# Altium schematic sheet AD592_2.SchDoc: AD592BNZ
size 410 x 297 mm; ApprovedBy: Стерхов В.Д.; CheckedBy: Стерхов В.Д.; Author: Сергеев Д.А.; CompanyName: ГК "СНАБЖЕНИЕ"; Engineer: Сергеев Д.А.; Organization: ГК "СНАБЖЕНИЕ"; DocumentNumber: ИЛ1339ТО1/1; SheetNumber: 2; SheetTotal: 3
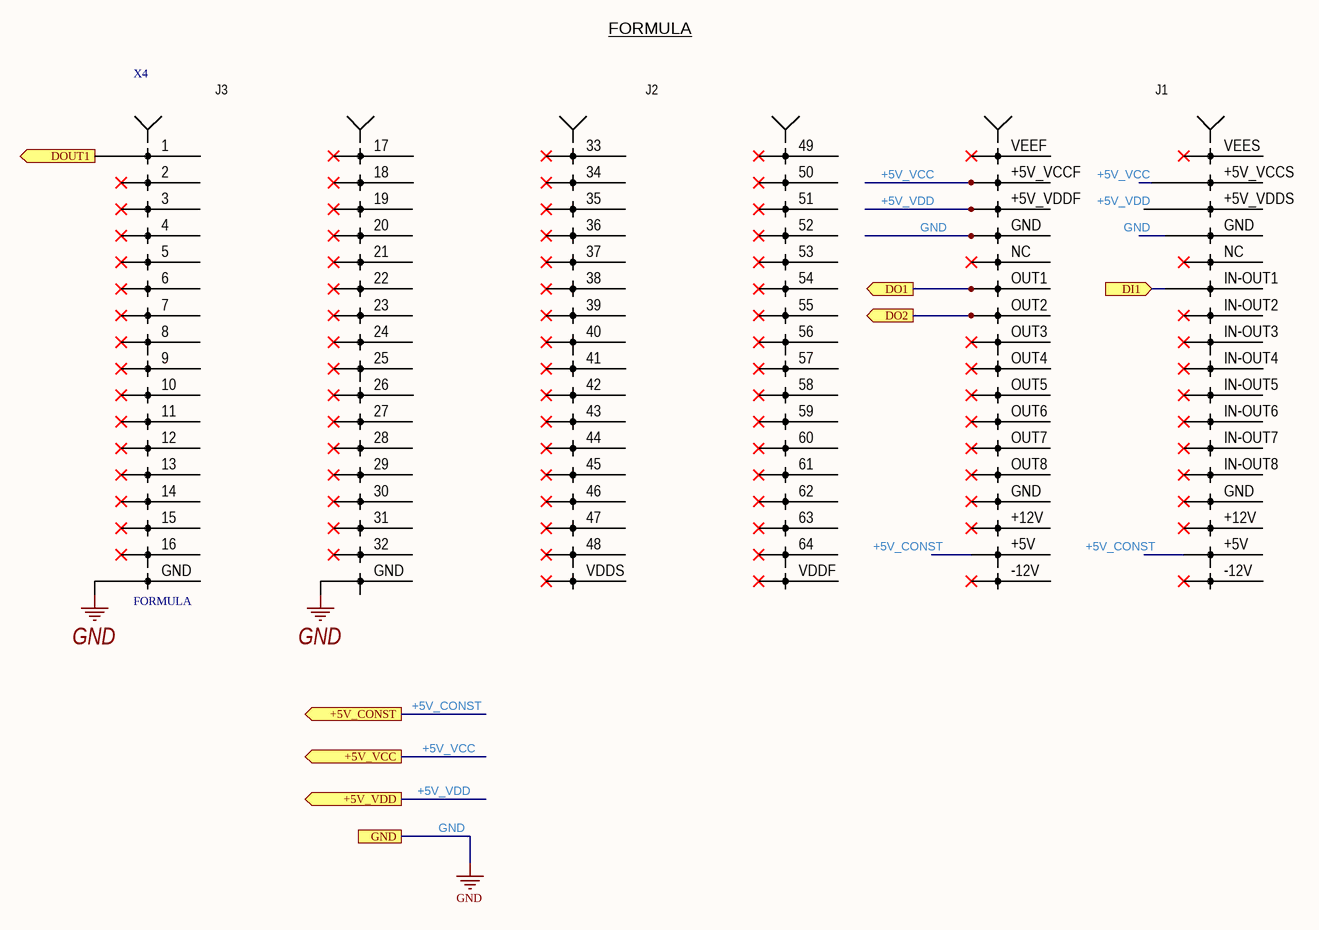
[diagram p0: AD592_2.SchDoc]

## Parts
X4  FORMULA  [FORMULA]

## Ports
+5V_CONST (out), +5V_VCC (out), +5V_VDD (out), DI1 (in), DO1 (out), DO2 (out), DOUT1 (out), GND

## Nets
GND: X4.GND ; port GND
+5V_CONST: X4.+5V ; port +5V_CONST
+5V_VCC: X4.+5V_VCCF(VCCF) X4.+5V_VCCS(VCCS) ; port +5V_VCC
+5V_VDD: X4.+5V_VDDF(VDDF) X4.+5V_VDDS(VDDS) ; port +5V_VDD
DI1: X4.IN-OUT1 ; port DI1
DO1: X4.OUT1 ; port DO1
DO2: X4.OUT2 ; port DO2
DOUT1: X4.1 ; port DOUT1

Not connected (* = marked no-connect by the designer): X4 2* 3* 4* 5* 6* 7* 8* 9* 10* 11* 12* 13* 14* 15* 16* 17* 18* 19* 20* 21* 22* 23* 24* 25* 26* 27* 28* 29* 30* 31* 32* 33* 34* 35* 36(4)* 37(5)* 38* 39* 40* 41* 42* 43* 44* 45* 46* 47* 48* 49* 50* 51* 52* 53* 54* 55* 56* 57* 58* 59* 60* 61* 62* 63* 64* +12V* -12V* IN-OUT2* IN-OUT3* IN-OUT4* IN-OUT5* IN-OUT6* IN-OUT7* IN-OUT8* NC* OUT3* OUT4* OUT5* OUT6* OUT7* OUT8* VDDF* VDDS* VEEF* VEES*

## Notes on the sheet
- FORMULA
- Перв. примен.
- Справ. №
- Подп. и дата
- Инв. № дубл.
- Взам. инв. №
- Разраб.
- Изм.
- Лист
- № докум.
- Подп.
- Дата
- Литера
- Масса
- Масштаб
- Пров.
- Т.контр.
- Листов
- Инв. № подл.
- Н.контр.
- Утв.
- Форма 1 ГОСТ 2.104-2006
- Копировал
- Формат А3
- (in symbol FORMULA) J3; J2; J1